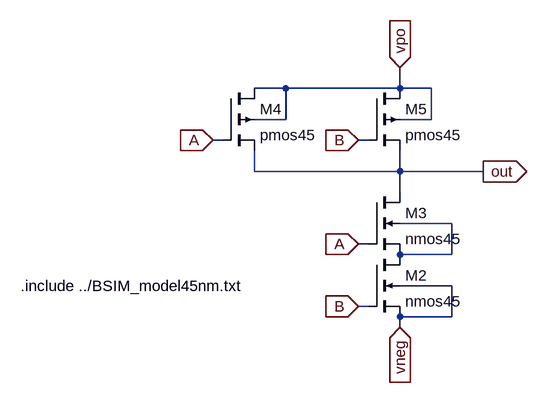
[diagram p0: schematic NAND.asc]
NAND.asc, the LTspice schematic file:
Version 4
SHEET 1 880 680
WIRE 16 -64 -32 -64
WIRE 192 -64 192 -96
WIRE 192 -64 16 -64
WIRE 240 -64 192 -64
WIRE 16 -16 16 -64
WIRE 16 -16 -32 -16
WIRE 240 -16 240 -64
WIRE 240 -16 192 -16
WIRE -80 16 -96 16
WIRE 144 16 128 16
WIRE -32 64 -32 32
WIRE 192 64 192 32
WIRE 192 64 -32 64
WIRE 320 64 192 64
WIRE 192 96 192 64
WIRE 272 144 192 144
WIRE 144 176 128 176
WIRE 272 192 272 144
WIRE 272 192 192 192
WIRE 272 240 192 240
WIRE 144 272 128 272
WIRE 272 288 272 240
WIRE 272 288 192 288
WIRE 192 304 192 288
FLAG -96 16 A
IOPIN -96 16 In
FLAG 128 16 B
IOPIN 128 16 In
FLAG 192 -96 vpo
IOPIN 192 -96 In
FLAG 128 176 A
IOPIN 128 176 In
FLAG 128 272 B
IOPIN 128 272 In
FLAG 320 64 out
IOPIN 320 64 Out
FLAG 192 304 vneg
IOPIN 192 304 In
SYMBOL nmos4 144 192 R0
SYMATTR InstName M2
SYMATTR Value nmos45
SYMATTR Value2 l=60nm w=200nm
SYMBOL nmos4 144 96 R0
SYMATTR InstName M3
SYMATTR Value nmos45
SYMATTR Value2 l=60nm w=200nm
SYMBOL pmos4 -80 -64 R0
SYMATTR InstName M4
SYMATTR Value pmos45
SYMATTR Value2 l=60nm w=400nm
SYMBOL pmos4 144 -64 R0
SYMATTR InstName M5
SYMATTR Value pmos45
SYMATTR Value2 l=60nm w=400nm
TEXT -392 240 Left 2 !.include ../BSIM_model45nm.txt

The netlist it stands for:
* NAND.asc
M2 N001 B vneg vneg nmos45 l=60nm w=200nm
M3 out A N001 N001 nmos45 l=60nm w=200nm
M4 vpo A out vpo pmos45 l=60nm w=400nm
M5 vpo B out vpo pmos45 l=60nm w=400nm
.model NMOS NMOS
.model PMOS PMOS
.lib standard.mos
.include ../BSIM_model45nm.txt
.backanno
.end